# Altium schematic sheet LED_Driver.SchDoc
size A4; SheetNumber: 1; SheetTotal: 1
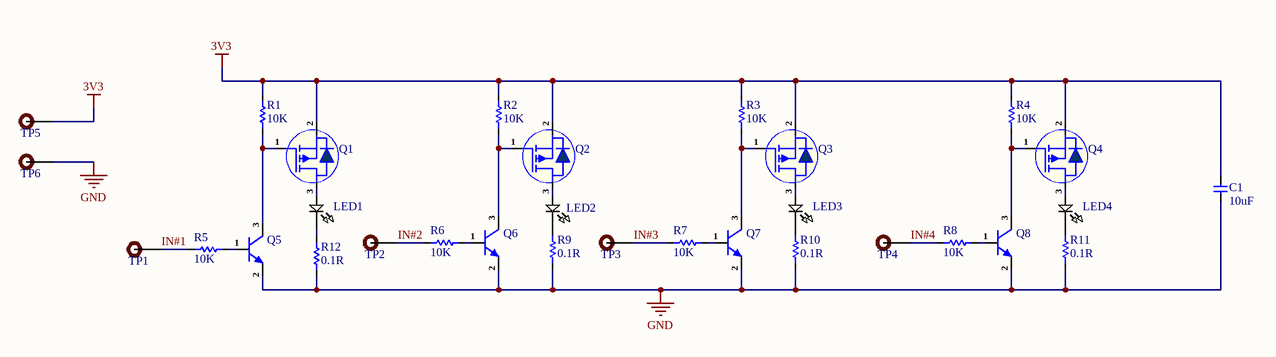
[diagram p0: LED_Driver.SchDoc]

## Parts
C1  10uF  [Cap-1206]
LED1  GW PUSTA1.CM-MENE-XX53-1-1050-R18  [GW PUSTA1.CM-MENE-XX53-1-1050-R18]  (value not drawn)
LED2  GW PUSTA1.CM-MENE-XX53-1-1050-R18  [GW PUSTA1.CM-MENE-XX53-1-1050-R18]  (value not drawn)
LED3  GW PUSTA1.CM-MENE-XX53-1-1050-R18  [GW PUSTA1.CM-MENE-XX53-1-1050-R18]  (value not drawn)
LED4  GW PUSTA1.CM-MENE-XX53-1-1050-R18  [GW PUSTA1.CM-MENE-XX53-1-1050-R18]  (value not drawn)
Q1  SSM3J328R,LF  [SOT-23F]  (value not drawn)
Q2  SSM3J328R,LF  [SOT-23F]  (value not drawn)
Q3  SSM3J328R,LF  [SOT-23F]  (value not drawn)
Q4  SSM3J328R,LF  [SOT-23F]  (value not drawn)
Q5  BC817 6B 160-400  [SOT-23]  (value not drawn)
Q6  BC817 6B 160-400  [SOT-23]  (value not drawn)
Q7  BC817 6B 160-400  [SOT-23]  (value not drawn)
Q8  BC817 6B 160-400  [SOT-23]  (value not drawn)
R1  10K  [Res-0603]
R2  10K  [Res-0603]
R3  10K  [Res-0603]
R4  10K  [Res-0603]
R5  10K  [Res-0603]
R6  10K  [Res-0603]
R7  10K  [Res-0603]
R8  10K  [Res-0603]
R9  0.1R  [Res-1206]
R10  0.1R  [Res-1206]
R11  0.1R  [Res-1206]
R12  0.1R  [Res-1206]
TP1  TEST POINT  [Test-point]  (value not drawn)  (no BOM)
TP2  TEST POINT  [Test-point]  (value not drawn)  (no BOM)
TP3  TEST POINT  [Test-point]  (value not drawn)  (no BOM)
TP4  TEST POINT  [Test-point]  (value not drawn)  (no BOM)
TP5  TEST POINT  [Test-point]  (value not drawn)  (no BOM)
TP6  TEST POINT  [Test-point]  (value not drawn)  (no BOM)

## Nets
3V3: C1.2 Q1.2(S) Q2.2(S) Q3.2(S) Q4.2(S) R1.2 R2.2 R3.2 R4.2 TP5.1
GND: C1.1 Q5.2(E) Q6.2(E) Q7.2(E) Q8.2(E) R9.1 R10.1 R11.1 R12.1 TP6.1
IN#1: R5.2 TP1.1
IN#2: R6.2 TP2.1
IN#3: R7.2 TP3.1
IN#4: R8.2 TP4.1
NetLED1_1: LED1.1(AN+) Q1.3(D)
NetLED1_2: LED1.2(CA-) R12.2
NetLED2_1: LED2.1(AN+) Q2.3(D)
NetLED2_2: LED2.2(CA-) R9.2
NetLED3_1: LED3.1(AN+) Q3.3(D)
NetLED3_2: LED3.2(CA-) R10.2
NetLED4_1: LED4.1(AN+) Q4.3(D)
NetLED4_2: LED4.2(CA-) R11.2
NetQ1_1: Q1.1(G) Q5.3(C) R1.1
NetQ2_1: Q2.1(G) Q6.3(C) R2.1
NetQ3_1: Q3.1(G) Q7.3(C) R3.1
NetQ4_1: Q4.1(G) Q8.3(C) R4.1
NetQ5_1: Q5.1(B) R5.1
NetQ6_1: Q6.1(B) R6.1
NetQ7_1: Q7.1(B) R7.1
NetQ8_1: Q8.1(B) R8.1

## Notes on the sheet
- File:
- Title:
- Date:
- Page
- Num:
- Total:
- Drawn By: Huzaifa Ali

## Library data of the parts
C1 = CC1206KKX5R9BB106: CAP CER 10UF 50V X5R 1206; Manufacturer: Yageo; Item Type: Capacitors; Material: 4241ConductorMaterial; Tolerance: 10%; Supplier: Future Electronics; Supplier Part Number: 2072123; Manufacturer Part Number: CC1206KKX5R9BB106; RoHS: Yes; Stock: 220000; Pricing: 2000=0.0907, 6000=0.0872, 10000=0.0856, 30000=0.0823, 50000=0.0795 (USD); Mounting Technology: Surface Mount; Case/Package: 1206; Case Code (Imperial): 1206; Case Code (Metric): 3216; Min Operating Temperature: -55°C; Max Operating Temperature: 85°C; Packaging: Cut Tape; Value: 10uF; Voltage Rating: 50V; Voltage Rating (DC): 50V; Dielectric: X5R; Series: CC; Length: 0.126inch; Width: 0.063inch; Height: 1.9mm; Thickness: 0.075inch; Lead Free: Lead Free; Halogen Free: Halogen Free; RoHS Compliant: Yes; ComponentLink1URL: https://datasheet.octopart.com/CC1206KKX5R9BB106-Yageo-datasheet-170350636.pdf?src-supplier=Future+Electronics; ComponentLink1Description: https://datasheet.octopart.com/CC1206KKX5R9BB106-Yageo-datasheet-170350636.pdf?src-supplier=Future+Electronics; ComponentLink2URL: https://datasheet.octopart.com/CC1206KKX5R9BB106-Yageo-datasheet-145016144.pdf?src-supplier=Future+Electronics; ComponentLink2Description: https://datasheet.octopart.com/CC1206KKX5R9BB106-Yageo-datasheet-145016144.pdf?src-supplier=Future+Electronics; ComponentLink3URL: http://www.yageo.com/documents/recent/UPY-GPHC_X5R_4V-to-50V_25.pdf?src-supplier=Digikey; ComponentLink3Description: http://www.yageo.com/documents/recent/UPY-GPHC_X5R_4V-to-50V_25.pdf?src-supplier=Digikey; LCSC Part Number: C100122
LED1-LED4 = GW PUSTA1.CM-MENE-XX53-1-1050-R18: LED OSCONIQ COOL WHT 5000K 3SMD; Manufacturer: ams-OSRAM USA INC.; Manufacturer Part Number: GW PUSTA1.CM-MENE-XX53-1-1050-R18; Package: Custom; Item Type: LED; ComponentLink1Description: Digikey; ComponentLink1URL: https://www.digikey.nl/en/products/detail/ams-osram-usa-inc/GW-PUSTA1-CM-MENE-XX53-1-1050-R18/11643254
Q1-Q4 = SSM3J328R,LF: MOSFET P-CH 20V 6A SOT23F; Manufacturer: Toshiba; Item Type: MOSFETs; Rds On Max: 29.8mR; Input Capacitance: 840pF; Max Power Dissipation: 1W; Gate to Source Voltage (Vgs): 8V; Turn-Off Delay Time: 107ns; Turn-On Delay Time: 32ns; Number of Channels: 1; Drain to Source Resistance: 47.4mR; Polarity: P-CHANNEL; Supplier: Digikey; LCSC Part Number: C396016; Manufacturer Part Number: SSM3J328R,LF; RoHS: Yes; Stock: 582786; Pricing: 1=0.41, 10=0.252, 100=0.1588, 500=0.11846, 1000=0.10542 (USD); Mounting Technology: Surface Mount; Case/Package: SOT-23-3; Min Operating Temperature: -55°C; Max Operating Temperature: 150°C; Continuous Drain Current (ID): 6A; Package Quantity: 3000; Packaging: Tape and Reel; Drain to Source Voltage (Vdss): 20V; Radiation Hardening: No; RoHS Compliant: Yes; ComponentLink1URL: https://datasheet.ciiva.com/11158/ssm3j328r-datasheet-en-20140301-11158652.pdf?src-supplier=Avnet; ComponentLink1Description: https://datasheet.ciiva.com/11158/ssm3j328r-datasheet-en-20140301-11158652.pdf?src-supplier=Avnet; ComponentLink2URL: https://datasheet.ciiva.com/24106/ssm3j328r-datasheet-en-20140301-24106699.pdf?src-supplier=Mouser; ComponentLink2Description: https://datasheet.ciiva.com/24106/ssm3j328r-datasheet-en-20140301-24106699.pdf?src-supplier=Mouser; ComponentLink3URL: https://datasheet.ciiva.com/45425/ssm3j328r-datasheet-en-20140301-45425519.pdf?src-supplier=Digikey; ComponentLink3Description: https://datasheet.ciiva.com/45425/ssm3j328r-datasheet-en-20140301-45425519.pdf?src-supplier=Digikey; ComponentLink4URL: https://datasheet.ciiva.com/45425/ssm3j328r-datasheet-en-20140301-45425813.pdf?src-supplier=Digikey; ComponentLink4Description: https://datasheet.ciiva.com/45425/ssm3j328r-datasheet-en-20140301-45425813.pdf?src-supplier=Digikey
Q5-Q8 = BC817 6B 160-400: 45V 300mW 100@100mA,1V 500mA NPN SOT-23 Bipolar Transistors - BJT ROHS; Manufacturer: DOWO; Manufacturer Part Number: BC817 6B 160-400; Package: SOT-23; LCSC Part Number: C371086; Item Type: Transistor; ComponentLink1Description: LCSC; ComponentLink1URL: https://www.lcsc.com/product-detail/Bipolar-Transistors-BJT_DOWO-BC817-6B-160-400_C371086.html
R1-R8 = RT0603BRD0710KL: RES SMD 10K OHM 0.1% 1/10W 0603; Manufacturer: Yageo; Power: 100mW; Rated Temperature: 70°C; Value: 10kR; Temperature Coefficient: 25ppm/°C; Working Voltage: 75V; Package Height: 0.45mm; Package Length: 1.6mm; Package Width: 0.8mm; Item Type: Resistor; Supplier 1: Rs; Manufacturer Part Number: RT0603BRD0710KL; RoHS: Yes; Category: Chip SMD Resistors; Stock 1: 20510; Pricing 1: 100=0.29800, 250=0.27800, 500=0.25900, 1000=0.23700 (GBP); Mounting Technology: Surface Mount; Pins: 2; Case/Package: 0603; Min Operating Temperature: -55°C; Max Operating Temperature: 155°C; Tolerance: 0.1%; Resistor Type: FIXED RESISTOR; Construction: Chip; Package Style: SMTMeter; Packaging: Tape and Reel; Technology: THIN FILM; Termination: Wraparound; Reach SVHC Compliant: Yes; RoHS Compliant: Yes; ComponentLink1URL: https://datasheet.ciiva.com:443/pdfs/VipMasterIC/IC/YAGO/YAGO-S-A0008510989/YAGO-S-A0008510989-1.pdf?src-supplier=IHS+Markit; ComponentLink1Description: https://datasheet.ciiva.com:443/pdfs/VipMasterIC/IC/YAGO/YAGO-S-A0008510989/YAGO-S-A0008510989-1.pdf?src-supplier=IHS+Markit; ComponentLink2URL: https://datasheet.ciiva.com/5624/pyu-rt-1-to-0-05-rohs-l-4-5624351.pdf?src-supplier=Mouser; ComponentLink2Description: https://datasheet.ciiva.com/5624/pyu-rt-1-to-0-05-rohs-l-4-5624351.pdf?src-supplier=Mouser; ComponentLink3URL: https://datasheet.ciiva.com/29721/pyu-rt-1-to-0-05-rohs-l-4-29721177.pdf?src-supplier=Digi-Key; ComponentLink3Description: https://datasheet.ciiva.com/29721/pyu-rt-1-to-0-05-rohs-l-4-29721177.pdf?src-supplier=Digi-Key; Supplier Part Number 1: 1991391P; LCSC Part Number: C95204
R9-R12 = RL1206FR-070R1L: RES 0.1 OHM 1% 1/4W 1206; Manufacturer: Yageo; Item Type: Resistor; Supplier: Future Electronics; Supplier Part Number: 1607134; Manufacturer Part Number: RL1206FR-070R1L; RoHS: Yes; Stock: 10000; Pricing: 5000=0.0214, 15000=0.02, 20000=0.0205, 25000=0.0197, 75000=0.0197, 125000=0.0184, 150000=0.0193, 375000=0.0184 (USD); Lead Free: 5697LeadFree; ComponentLink1URL: https://datasheet.ciiva.com/22699/877049-22699038.pdf?src-supplier=Element14; ComponentLink1Description: https://datasheet.ciiva.com/22699/877049-22699038.pdf?src-supplier=Element14; ComponentLink2URL: https://datasheet.ciiva.com/5558/pyu-rl-hp-521-rohs-l-2-5558071.pdf?src-supplier=Mouser; ComponentLink2Description: https://datasheet.ciiva.com/5558/pyu-rl-hp-521-rohs-l-2-5558071.pdf?src-supplier=Mouser
TP1-TP6 = TEST POINT: Test Point ON; Item Type: TEST POINT